# EAGLE schematic bare-metal-audio_2026-08-13 (EAGLE 9.7.0)
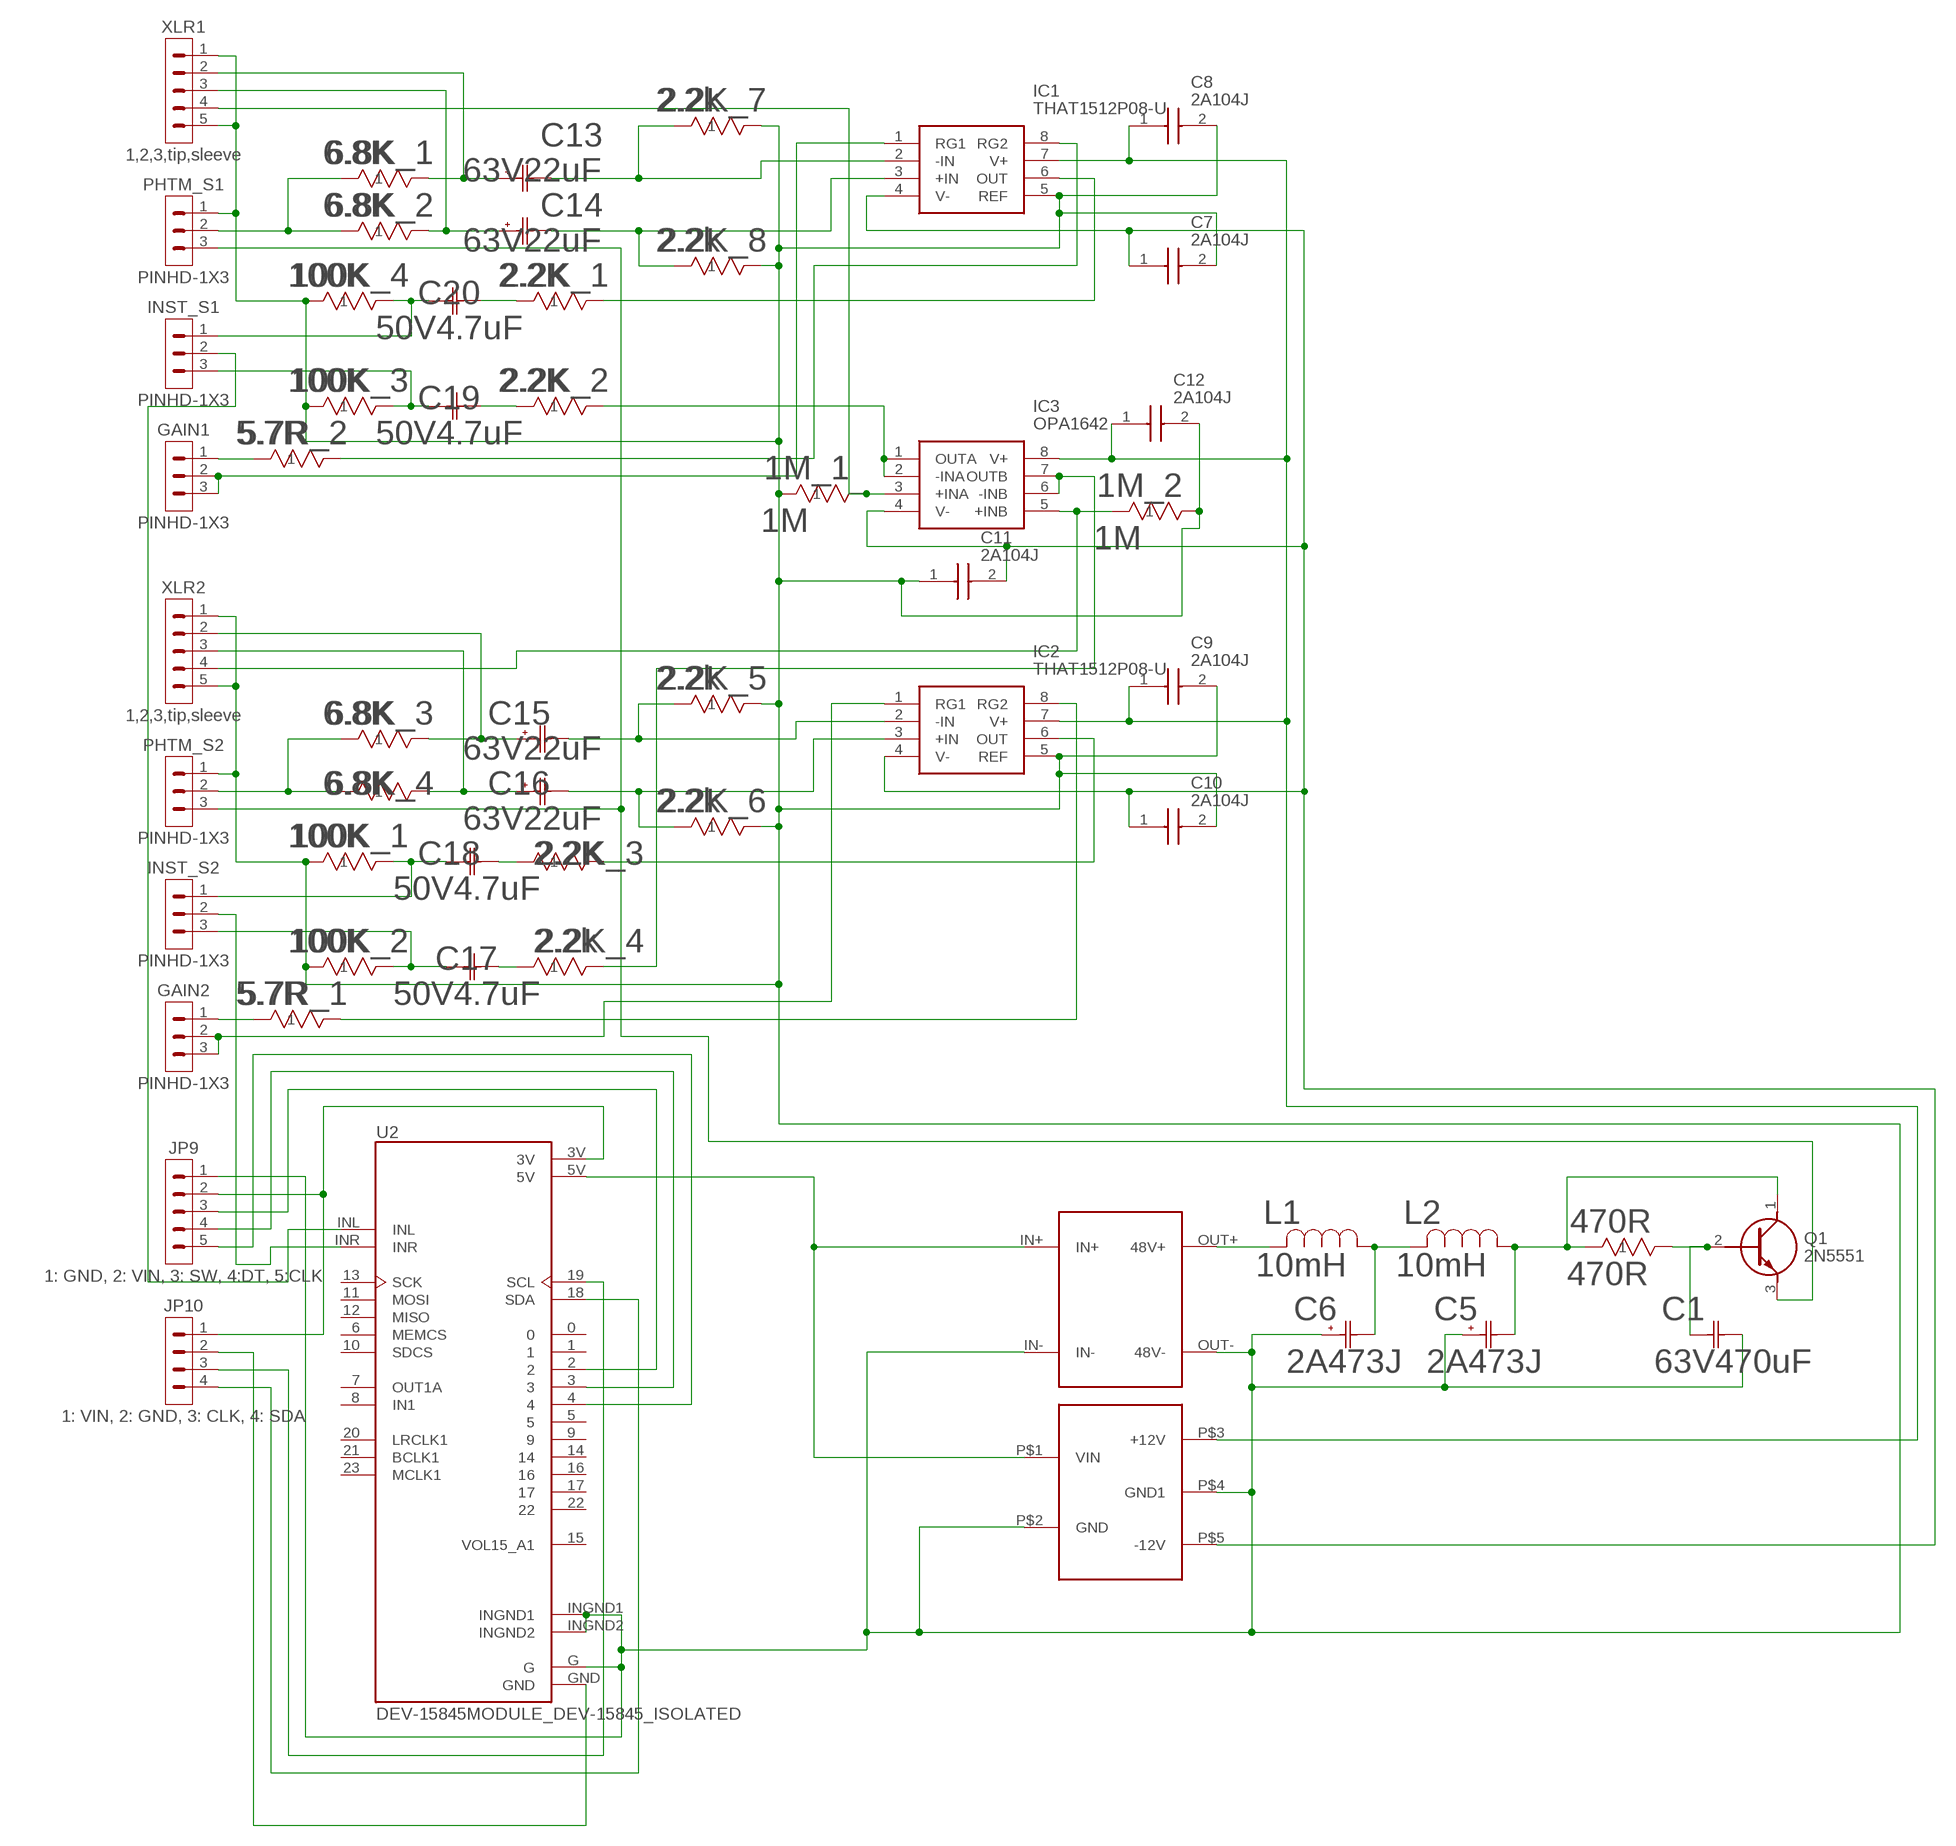
[diagram p0: schematic, sheet 1]

## Parts
1M_1  1M  YR1B100RCCRES_TYCO_YR1_TYC  [RES_TYCO_YR1_TYC]
1M_2  1M  YR1B100RCCRES_TYCO_YR1_TYC  [RES_TYCO_YR1_TYC]
2.2K_1  2.2K  YR1B100RCCRES_TYCO_YR1_TYC  [RES_TYCO_YR1_TYC]
2.2K_2  2.2K  YR1B100RCCRES_TYCO_YR1_TYC  [RES_TYCO_YR1_TYC]
2.2K_3  2.2K  YR1B100RCCRES_TYCO_YR1_TYC  [RES_TYCO_YR1_TYC]
2.2K_4  2.2k  YR1B100RCCRES_TYCO_YR1_TYC  [RES_TYCO_YR1_TYC]
2.2K_5  2.2k  YR1B100RCCRES_TYCO_YR1_TYC  [RES_TYCO_YR1_TYC]
2.2K_6  2.2k  YR1B100RCCRES_TYCO_YR1_TYC  [RES_TYCO_YR1_TYC]
2.2K_7  2.2k  YR1B100RCCRES_TYCO_YR1_TYC  [RES_TYCO_YR1_TYC]
2.2K_8  2.2k  YR1B100RCCRES_TYCO_YR1_TYC  [RES_TYCO_YR1_TYC]
5.7R_1  5.7R  YR1B100RCCRES_TYCO_YR1_TYC  [RES_TYCO_YR1_TYC]
5.7R_2  5.7R  YR1B100RCCRES_TYCO_YR1_TYC  [RES_TYCO_YR1_TYC]
6.8K_1  6.8K  YR1B100RCCRES_TYCO_YR1_TYC  [RES_TYCO_YR1_TYC]
6.8K_2  6.8K  YR1B100RCCRES_TYCO_YR1_TYC  [RES_TYCO_YR1_TYC]
6.8K_3  6.8K  YR1B100RCCRES_TYCO_YR1_TYC  [RES_TYCO_YR1_TYC]
6.8K_4  6.8K  YR1B100RCCRES_TYCO_YR1_TYC  [RES_TYCO_YR1_TYC]
100K_1  100K  YR1B100RCCRES_TYCO_YR1_TYC  [RES_TYCO_YR1_TYC]
100K_2  100K  YR1B100RCCRES_TYCO_YR1_TYC  [RES_TYCO_YR1_TYC]
100K_3  100K  YR1B100RCCRES_TYCO_YR1_TYC  [RES_TYCO_YR1_TYC]
100K_4  100K  YR1B100RCCRES_TYCO_YR1_TYC  [RES_TYCO_YR1_TYC]
470R  470R  YR1B100RCCRES_TYCO_YR1_TYC  [RES_TYCO_YR1_TYC]
C1  63V470uF  EEUFR1J471CAP_EEUFC_125X25_PAN  [CAP_EEUFC_125X25_PAN]
C5  2A473J  QYX2A473JTPCAP_QYX_4P5X8P5X14_NCH  [CAP_QYX_4P5X8P5X14_NCH]
C6  2A473J  QYX2A473JTPCAP_QYX_4P5X8P5X14_NCH  [CAP_QYX_4P5X8P5X14_NCH]
C7  2A104J  QYX2A104JTP  [QYX2A104JTP]
C8  2A104J  QYX2A104JTP  [QYX2A104JTP]
C9  2A104J  QYX2A104JTP  [QYX2A104JTP]
C10  2A104J  QYX2A104JTP  [QYX2A104JTP]
C11  2A104J  QYX2A104JTP  [QYX2A104JTP]
C12  2A104J  QYX2A104JTP  [QYX2A104JTP]
C13  63V22uF  UPW1J220MED1TDCAP_UEP_6P3X11_NCH  [CAP_UEP_6P3X11_NCH]
C14  63V22uF  UPW1J220MED1TDCAP_UEP_6P3X11_NCH  [CAP_UEP_6P3X11_NCH]
C15  63V22uF  UPW1J220MED1TDCAP_UEP_6P3X11_NCH  [CAP_UEP_6P3X11_NCH]
C16  63V22uF  UPW1J220MED1TDCAP_UEP_6P3X11_NCH  [CAP_UEP_6P3X11_NCH]
C17  50V4.7uF  EEAGA1H4R7CAP_4_X_7_PAN  [CAP_4_X_7_PAN]
C18  50V4.7uF  EEAGA1H4R7CAP_4_X_7_PAN  [CAP_4_X_7_PAN]
C19  50V4.7uF  EEAGA1H4R7CAP_4_X_7_PAN  [CAP_4_X_7_PAN]
C20  50V4.7uF  EEAGA1H4R7CAP_4_X_7_PAN  [CAP_4_X_7_PAN]
GAIN1  PINHD-1X3  [1X03]
GAIN2  PINHD-1X3  [1X03]
IC1  THAT1512P08-U  [DIP876W46P254L952H432Q8N]
IC2  THAT1512P08-U  [DIP876W46P254L952H432Q8N]
IC3  OPA1642  [DIP876W46P254L952H432Q8N]
INST_S1  PINHD-1X3  [1X03]
INST_S2  PINHD-1X3  [1X03]
JP9  1: GND, 2: VIN, 3: SW, 4:DT, 5:CLK  PINHD-1X5  [1X05]
JP10  1: VIN, 2: GND, 3: CLK, 4: SDA  PINHD-1X4  [1X04]
L1  10mH  B82144A2105J000IND_B82144A_12X5P2_TDK  [IND_B82144A_12X5P2_TDK]
L2  10mH  B82144A2105J000IND_B82144A_12X5P2_TDK  [IND_B82144A_12X5P2_TDK]
PHTM_S1  PINHD-1X3  [1X03]
PHTM_S2  PINHD-1X3  [1X03]
Q1  2N5551  [2N5551]
U2  DEV-15845MODULE_DEV-15845_ISOLATED  [MODULE_DEV-15845_ISOLATED]
U$1  XL6009_BOOST  [XL6009_FOOT]
U$2  DD1718PA_BOOST  [DD1718PA_FOOT]
XLR1  1,2,3,tip,sleeve  PINHD-1X5  [1X05]
XLR2  1,2,3,tip,sleeve  PINHD-1X5  [1X05]

## Nets
N$1: U2.5V U$1.IN+ U$2.P$1(VIN)
N$2: 6.8K_1.2 C13.1 XLR1.2
N$4: 1M_1.1 1M_2.2 2.2K_5.2 2.2K_6.2 2.2K_7.2 2.2K_8.2 100K_1.1 100K_2.1 100K_3.1 100K_4.1 C1.2 C5.1 C6.1 C7.2 C8.2 C9.2 C10.2 C11.1 C12.2 IC1.5(REF) IC2.5(REF) JP9.1 PHTM_S1.1 PHTM_S2.1 U2.G U2.INGND1 U2.INGND2 U$1.IN- U$1.OUT-(48V-) U$2.P$2(GND) U$2.P$4(GND1) XLR1.1 XLR1.5 XLR2.1 XLR2.5
N$5: JP10.4 U2.18(SDA)
N$6: JP9.3 U2.2
N$7: JP9.4 U2.3
N$8: JP9.5 U2.4
N$9: L1.2 U$1.OUT+(48V+)
N$10: C6.2 L1.1 L2.2
N$11: 470R.1 C5.2 L2.1 Q1.1(C)
N$12: 470R.2 C1.1 Q1.2(B)
N$13: PHTM_S1.3 PHTM_S2.3 Q1.3(E)
N$14: 6.8K_1.1 6.8K_2.1 PHTM_S1.2
N$15: 6.8K_3.1 6.8K_4.1 PHTM_S2.2
N$16: 6.8K_3.2 C15.1 XLR2.2
N$17: 6.8K_4.2 C16.1 XLR2.3
N$18: 2.2K_6.1 C16.2 IC2.3(+IN)
N$19: 2.2K_5.1 C15.2 IC2.2(-IN)
N$20: GAIN1.2 GAIN1.3 IC1.1(RG1)
N$21: 6.8K_2.2 C14.1 XLR1.3
N$22: 2.2K_7.1 C13.2 IC1.2(-IN)
N$23: 2.2K_8.1 C14.2 IC1.3(+IN)
N$24: 100K_1.2 C18.1 INST_S2.1
N$25: 5.7R_2.1 GAIN1.1
N$26: 5.7R_1.1 GAIN2.1
N$27: GAIN2.2 GAIN2.3 IC2.1(RG1)
N$28: 5.7R_1.2 IC2.8(RG2)
N$29: 5.7R_2.2 IC1.8(RG2)
N$30: C8.1 C9.1 C12.1 IC1.7(V+) IC2.7(V+) IC3.8(V+) U$2.P$3(+12V)
N$31: C7.1 C10.1 C11.2 IC1.4(V-) IC2.4(V-) IC3.4(V-) U$2.P$5(-12V)
N$32: 2.2K_1.2 IC1.6(OUT)
N$33: 2.2K_1.1 C20.2
N$34: 100K_4.2 C20.1 INST_S1.1
N$35: 100K_3.2 C19.1 INST_S1.3
N$36: 2.2K_2.1 C19.2
N$37: 2.2K_4.2 IC3.6(-INB) IC3.7(OUTB)
N$38: 100K_2.2 C17.1 INST_S2.3
N$39: 2.2K_4.1 C17.2
N$40: 2.2K_3.1 C18.2
N$41: 2.2K_3.2 IC2.6(OUT)
N$43: 2.2K_2.2 IC3.1(OUTA) IC3.2(-INA)
N$44: 1M_1.2 IC3.3(+INA) XLR1.4
N$45: 1M_2.1 IC3.5(+INB) XLR2.4
N$46: INST_S2.2 U2.INR
N$47: INST_S1.2 U2.INL
N$48: JP10.2 U2.GND
N$49: JP10.3 U2.19(SCL)
VOL_3.3V: JP9.2 JP10.1 U2.3V
Unconnected: U2.0 U2.1 U2.5 U2.6(MEMCS) U2.7(OUT1A) U2.8(IN1) U2.9 U2.10(SDCS) U2.11(MOSI) U2.12(MISO) U2.13(SCK) U2.14 U2.15(VOL15_A1) U2.16 U2.17 U2.20(LRCLK1) U2.21(BCLK1) U2.22 U2.23(MCLK1)

## Library data of the parts
1M_1 1M_2 2.2K_1-2.2K_8 5.7R_1 5.7R_2 6.8K_1-6.8K_4 100K_1-100K_4 470R = Library_2:YR1B100RCC
C1 = Library_2:EEUFR1J471
C5 C6 = Library_2:QYX2A473JTP
C7-C12 = Library_2:QYX2A104JTP: Film Capacitors 100V 0.1uF 10% Source: Datasheet <http://www.nichicon.co.jp/english/products/pdfs/e-qyx.pdf>
C13-C16 = Library_2:UPW1J220MED1TD
C17-C20 = Library_2:EEAGA1H4R7
GAIN1 GAIN2 INST_S1 INST_S2 PHTM_S1 PHTM_S2 = Connector:PINHD-1X3: Pin Header
IC1 IC2 = THAT_LIBRARY:THAT1512P08-U: THAT CORPORATION - THAT1512P08-U - IC, PRE-AMP, MICROPHONE, DIP8 Source: Datasheet <https://componentsearchengine.com/Datasheets/2/THAT1512P08-U.pdf>
IC3 = THAT_LIBRARY_2:OPA1642: THAT CORPORATION - THAT1512P08-U - IC, PRE-AMP, MICROPHONE, DIP8 Source: Datasheet <https://componentsearchengine.com/Datasheets/2/THAT1512P08-U.pdf>
JP9 XLR1 XLR2 = Connector:PINHD-1X5: Pin Header
JP10 = Connector:PINHD-1X4: Pin Header
L1 L2 = Library_2:B82144A2105J000
Q1 = Library_2:2N5551: NPN high-voltage transistors 300 mA,160 V,50 nA,30 pF, 300 MHz 65 +150 C Source: Datasheet <https://www.nxp.com/docs/en/data-sheet/2N5550_5551.pdf>
U2 = DEV-15845_updated:DEV-15845: Check availability <https://pricing.snapeda.com/parts/DEV-15845/SparkFun%20Electronics/view-part?ref=eda>
U$1 = Library:XL6009_BOOST
U$2 = Library:DD1718PA_BOOST